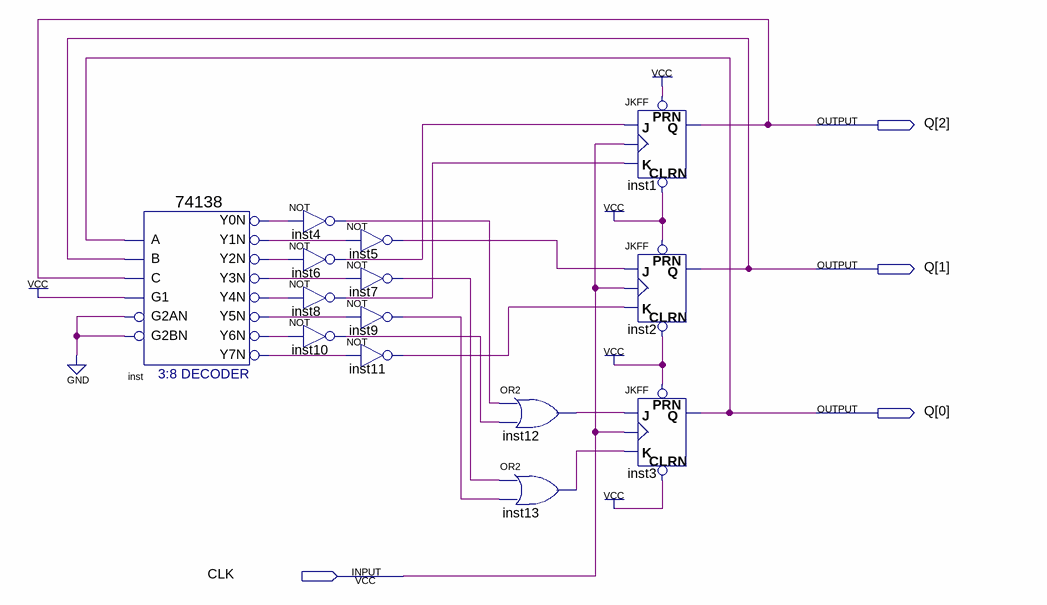
[diagram p0: schematic sheet]
// Quartus schematic Graycode.bdf as structural Verilog: 14 symbols, 4 pins
module Graycode (
  input  CLK,
  output [2:0] Q
);

  wire inst4_out, inst5_out, inst6_out, inst7_out, inst8_out, inst9_out, inst10_out, inst11_out, inst12_out,
       inst13_out, inst_y0n, inst_y1n, inst_y2n, inst_y3n, inst_y4n, inst_y5n, inst_y6n, inst_y7n;

  \74138  inst (
    .A(Q[0]), .B(Q[1]), .G1(1'b1), .C(Q[2]), .G2AN(1'b0), .G2BN(1'b0), .Y0N(inst_y0n), .Y1N(inst_y1n),
    .Y2N(inst_y2n), .Y3N(inst_y3n), .Y4N(inst_y4n), .Y5N(inst_y5n), .Y6N(inst_y6n), .Y7N(inst_y7n));
  not inst4 (inst4_out, inst_y0n);
  not inst6 (inst6_out, inst_y2n);
  not inst8 (inst8_out, inst_y4n);
  not inst10 (inst10_out, inst_y6n);
  not inst5 (inst5_out, inst_y1n);
  not inst7 (inst7_out, inst_y3n);
  not inst9 (inst9_out, inst_y5n);
  not inst11 (inst11_out, inst_y7n);
  or inst12 (inst12_out, inst4_out, inst10_out);
  or inst13 (inst13_out, inst7_out, inst9_out);
  JKFF inst1 (.PRN(1'b1), .CLRN(1'b1), .K(inst8_out), .J(inst6_out), .CLK(CLK), .Q(Q[2]));
  JKFF inst2 (.PRN(1'b1), .CLRN(1'b1), .K(inst11_out), .J(inst5_out), .CLK(CLK), .Q(Q[1]));
  JKFF inst3 (.PRN(1'b1), .CLRN(1'b1), .K(inst13_out), .J(inst12_out), .CLK(CLK), .Q(Q[0]));
endmodule
